# Altium project Karta_Radiowa_ILS_TETRA.PrjPcb (part 9 of 9)

## Sheet Current_volatge_meas.SchDoc: Current measurement
size A3; SheetNumber: 11; SheetTotal: 17
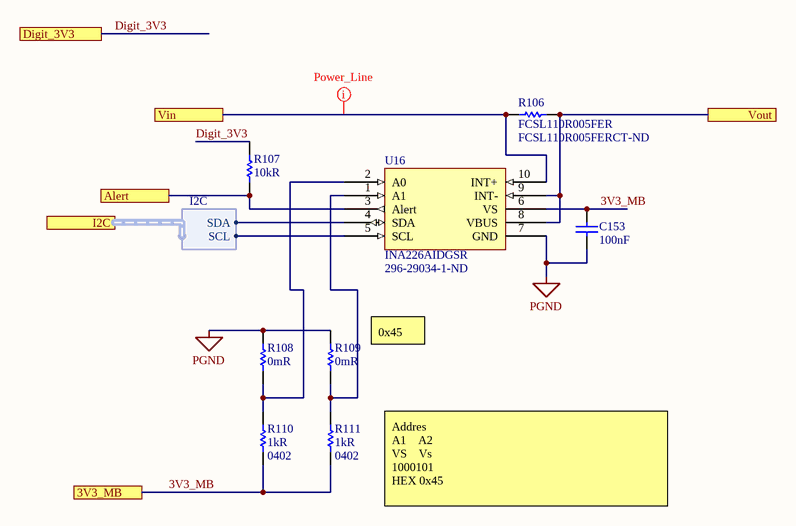
[diagram p13: Current_volatge_meas.SchDoc]

### Parts
C153  100nF  [CAP 0201/0603 KK]
R106  FCSL110R005FER  [FCSL110R005FERCT-ND]
R107  10kR  [RES 0402/1005 RF KK]
R108  0mR  [RES 0402/1005 RF KK]
R109  0mR  [RES 0402/1005 RF KK]
R110  1kR  Case/Package: 0402  [RES 0402/1005 RF KK]
R111  1kR  Case/Package: 0402  [RES 0402/1005 RF KK]
U16  INA226AIDGSR  Supplier Part Number 1: 296-29034-1-ND  [INA226]

### Ports
3V3_MB, Alert, Digit_3V3, I2C (harness I2C), Vin, Vout

### Harnesses
I2C: SDA, SCL

### Nets
+12: R106.1 U16.10(INT+) ; port Vin
PGND: C153.1 R108.2 R109.2 U16.7(GND)
3V3_MB: C153.2 R110.1 R111.1 U16.6(VS) ; port 3V3_MB
12V: R106.2 U16.8(VBUS) U16.9(INT-) ; port Vout
Alert_curr_vol_meas: R107.1 U16.3(Alert) ; port Alert
Digit_3V3: R107.2 ; port Digit_3V3  [project net 3V3_DIGIT]
I2C_SCL: U16.5(SCL) ; port I2C.SCL
I2C_SDA: U16.4(SDA) ; port I2C.SDA
NetR108_1: R108.1 R110.2 U16.2(A0)
NetR109_1: R109.1 R111.2 U16.1(A1)

### Layout directives
net class Power_LINE: +12

### Notes on the sheet
- (near R109) 0x45
- Addres
  A1    A2
  VS    Vs
  1000101
  HEX 0x45
- Title
- Size:
- Date:
- A3
- Number:
- Time:
- Revision:
- Sheet
- of
- File:

### Library data of the parts
C153 = Capacitor: Manufacturer 1: Murata; Manufacturer Part Number 1: GRM033R61C104ME84D; Voltage Rating: 16V; Tolerance: 20%; Dielectric: X5R; Supplier 1: Digi-Key; Supplier Part Number 1: 490-9986-1-ND; Stock 1: 503570; Pricing 1: 1=0.10000, 10=0.05400, 100=0.02430, 500=0.01732, 1000=0.01361, 2500=0.01238, 5000=0.01139 (USD); RoHS: Yes; Mount: Surface Mount; Case/Package: 0201; Weight: 1.2E-05oz; Case Code (Metric): 0603; Case Code (Imperial): 0201; Min Operating Temperature: -55°C; Max Operating Temperature: 85°C; Capacitance: 100nF; Packaging: Tape and Reel; Termination: SMD/SMT; Voltage Rating (DC): 16V; Package Quantity: 15000; Length: 0.024inch; Height: 0.3mm; Width: 0.3mm; Thickness: 0.013inch; ComponentLink1URL: http://www.mouser.com/ds/2/281/c02e-2905.pdf?src-supplier=Mouser; ComponentLink1Description: http://www.mouser.com/ds/2/281/c02e-2905.pdf?src-supplier=Mouser; ComponentLink2URL: http://search.murata.co.jp/Ceramy/image/img/A01X/G101/ENG/GRM033R61C104ME84-01.pdf?src-supplier=Digi-Key; ComponentLink2Description: http://search.murata.co.jp/Ceramy/image/img/A01X/G101/ENG/GRM033R61C104ME84-01.pdf?src-supplier=Digi-Key
R106 = FCSL110R005FER: RES SMD 5 MOHM 5W 4320 WIDE; Manufacturer: Ohmite; Tolerance: 1%; Resistance: 5mR; Temperature Coefficient: 50ppm/°C; Supplier 1: Digi-Key; Manufacturer Part Number: FCSL110R005FER; Stock 1: 3877; Pricing 1: 1 = 2,79000, 10 = 2,47700, 25 = 2,29720, 50 = 2,16220, 100 = 1,89190, 250 = 1,62164, 500 = 1,35136 (USD); RoHS: Yes; Case/Package: Metal; Number of Pins: 2; Min Operating Temperature: -55°C; Max Operating Temperature: 155°C; Packaging: Tape and Reel; Package Quantity: 1; Max Power Dissipation: 5W; Features: Moisture Resistant; Power Rating: 5W; Termination: SMD/SMT; Composition: Metal Foil; Number of Terminations: 2; Length: 0.197inch; Height: 0.028inch; Width: 11mm; Depth: 5mm; REACH SVHC: Unknown; ComponentLink1URL: https://datasheet.ciiva.com/2484/res-fcsl-2484643.pdf?src-supplier=Digi-Key; ComponentLink1Description: https://datasheet.ciiva.com/2484/res-fcsl-2484643.pdf?src-supplier=Digi-Key; ComponentLink2URL: https://datasheet.ciiva.com/2484/res-fcsl-2484644.pdf?src-supplier=Digi-Key; ComponentLink2Description: https://datasheet.ciiva.com/2484/res-fcsl-2484644.pdf?src-supplier=Digi-Key; ComponentLink3URL: https://datasheet.ciiva.com/2484/res-fcsl-2484645.pdf?src-supplier=Digi-Key; ComponentLink3Description: https://datasheet.ciiva.com/2484/res-fcsl-2484645.pdf?src-supplier=Digi-Key; ComponentLink4URL: https://datasheet.ciiva.com/6181/fcsl-6181333.pdf?src-supplier=Farnell; ComponentLink4Description: https://datasheet.ciiva.com/6181/fcsl-6181333.pdf?src-supplier=Farnell; ComponentLink5URL: https://datasheet.ciiva.com/46422/1812595-46422917.pdf?src-supplier=Element14; ComponentLink5Description: https://datasheet.ciiva.com/46422/1812595-46422917.pdf?src-supplier=Element14; ComponentLink6URL: https://datasheet.ciiva.com/8080/fcsl-8080343.pdf?src-supplier=Element14; ComponentLink6Description: https://datasheet.ciiva.com/8080/fcsl-8080343.pdf?src-supplier=Element14; Supplier Part Number 1: FCSL110R005FERCT-ND
R107 = Resistor: Manufacturer 1: Vishay; Manufacturer Part Number 1: CRCW0402-10K0FKED; Tolerance: 1%; Power Rating: 63mW; Voltage Rating: 50V; Temperature Coefficient: 100ppm/°C; Supplier 1: Newark; Supplier Part Number 1: 52K6595; Stock 1: 0; RoHS: Yes; Mount: Surface Mount; Case/Package: 0402; Number of Pins: 2; Weight: 2.3E-05oz; Case Code (Metric): 1005; Case Code (Imperial): 0402; Contact Plating: Tin; Min Operating Temperature: -55°C; Max Operating Temperature: 155°C; Resistance: 10kR; Package Quantity: 10; Packaging: Tape and Reel; Termination: SMD/SMT; Military Standard: Not; Composition: Thick Film; Voltage Rating (DC): 50V; Number of Terminations: 2; Max Power Dissipation: 63mW; Features: Automotive AEC-Q200; Length: 1mm; Height: 0.35mm; Depth: 0.5mm; Width: 0.02inch; Radiation Hardening: No; REACH SVHC: Unknown; Lead Free: Lead Free; ComponentLink1URL: https://datasheet.ciiva.com/11809/0900766b80d98824-11809984.pdf?src-supplier=RSComponents; ComponentLink1Description: https://datasheet.ciiva.com/11809/0900766b80d98824-11809984.pdf?src-supplier=RSComponents; ComponentLink2URL: https://datasheet.ciiva.com/2463/dcrcwe3-2463025.pdf?src-supplier=Digi-Key; ComponentLink2Description: https://datasheet.ciiva.com/2463/dcrcwe3-2463025.pdf?src-supplier=Digi-Key; ComponentLink3URL: https://datasheet.ciiva.com/2463/dcrcwe3-2463026.pdf?src-supplier=Digi-Key; ComponentLink3Description: https://datasheet.ciiva.com/2463/dcrcwe3-2463026.pdf?src-supplier=Digi-Key; ComponentLink4URL: https://datasheet.ciiva.com/2463/dcrcwe3-2463027.pdf?src-supplier=Digi-Key; ComponentLink4Description: https://datasheet.ciiva.com/2463/dcrcwe3-2463027.pdf?src-supplier=Digi-Key; ComponentLink5URL: https://datasheet.ciiva.com/46385/1697337-46385560.pdf?src-supplier=Element14; ComponentLink5Description: https://datasheet.ciiva.com/46385/1697337-46385560.pdf?src-supplier=Element14; ComponentLink6URL: https://datasheet.ciiva.com/3255/dcrcwe3-3255961.pdf?src-supplier=Avnet; ComponentLink6Description: https://datasheet.ciiva.com/3255/dcrcwe3-3255961.pdf?src-supplier=Avnet; ComponentLink7URL: https://datasheet.ciiva.com/3255/dcrcwe3-3255962.pdf?src-supplier=Avnet; ComponentLink7Description: https://datasheet.ciiva.com/3255/dcrcwe3-3255962.pdf?src-supplier=Avnet; ComponentLink8URL: https://datasheet.ciiva.com/5547/dcrcwe3-109170-5547786.pdf?src-supplier=Mouser; ComponentLink8Description: https://datasheet.ciiva.com/5547/dcrcwe3-109170-5547786.pdf?src-supplier=Mouser; ComponentLink9URL: https://datasheet.ciiva.com/26316/fld-crcw-e3-data-en-26316618.pdf?src-supplier=Distrelec; ComponentLink9Description: https://datasheet.ciiva.com/26316/fld-crcw-e3-data-en-26316618.pdf?src-supplier=Distrelec; ComponentLink10URL: https://datasheet.ciiva.com/16208/dcrcwe3-16208525.pdf?src-supplier=Future+Electronics; ComponentLink10Description: https://datasheet.ciiva.com/16208/dcrcwe3-16208525.pdf?src-supplier=Future+Electronics; ComponentLink11URL: https://datasheet.ciiva.com/36856/1720486-36856909.pdf?src-supplier=Element14; ComponentLink11Description: https://datasheet.ciiva.com/36856/1720486-36856909.pdf?src-supplier=Element14
R108 R109 = Resistor: Manufacturer 1: Yageo; Manufacturer Part Number 1: RC0402JR-070RL; Power Rating: 62.5mW; Tolerance: 5%; Voltage Rating: 50V; Max Power Dissipation: 63mW; Temperature Coefficient: 200ppm/°C; Supplier 1: Digi-Key; Supplier Part Number 1: 311-0.0JRCT-ND; Stock 1: 69822252; Pricing 1: 1=0.10000, 10=0.01200, 25=0.00920, 50=0.00680, 100=0.00510, 250=0.00388, 500=0.00308, 1000=0.00227, 5000=0.00163 (USD); RoHS: Yes; Case/Package: 0402; Contact Plating: Tin,Matte; Case Code (Metric): 1005; Case Code (Imperial): 0402; Min Operating Temperature: -55°C; Max Operating Temperature: 155°C; Resistance: 0mR; Packaging: Tape and Reel; Composition: Thick Film; Package Quantity: 1; Number of Terminations: 2; Termination: SMD/SMT; Military Standard: Not; Features: Moisture Resistant; Length: 1mm; Height: 0.016inch; Width: 0.02inch; Depth: 0.5mm; Radiation Hardening: No; REACH SVHC: Unknown; Lead Free: Lead Free; ComponentLink1URL: https://datasheet.ciiva.com/2452/pyu-rc0402-51-rohs-l-6-2452608.pdf?src-supplier=Digi-Key; ComponentLink1Description: https://datasheet.ciiva.com/2452/pyu-rc0402-51-rohs-l-6-2452608.pdf?src-supplier=Digi-Key; ComponentLink2URL: https://datasheet.ciiva.com/11808/0900766b80c66297-11808195.pdf?src-supplier=RSComponents; ComponentLink2Description: https://datasheet.ciiva.com/11808/0900766b80c66297-11808195.pdf?src-supplier=RSComponents; ComponentLink3URL: https://datasheet.ciiva.com/2452/pyu-r-int-thick-7-2452609.pdf?src-supplier=Digi-Key; ComponentLink3Description: https://datasheet.ciiva.com/2452/pyu-r-int-thick-7-2452609.pdf?src-supplier=Digi-Key; ComponentLink4URL: https://datasheet.ciiva.com/22747/1018594-22747515.pdf?src-supplier=Element14; ComponentLink4Description: https://datasheet.ciiva.com/22747/1018594-22747515.pdf?src-supplier=Element14; ComponentLink5URL: https://datasheet.ciiva.com/7983/1018594-7983535.pdf?src-supplier=Element14; ComponentLink5Description: https://datasheet.ciiva.com/7983/1018594-7983535.pdf?src-supplier=Element14; ComponentLink6URL: https://datasheet.ciiva.com/2452/pyu-r-int-thick-7-2452610.pdf?src-supplier=Digi-Key; ComponentLink6Description: https://datasheet.ciiva.com/2452/pyu-r-int-thick-7-2452610.pdf?src-supplier=Digi-Key; ComponentLink7URL: https://datasheet.ciiva.com/8896/pyu-rc0402-51-rohs-l-6-8896201.pdf?src-supplier=Avnet; ComponentLink7Description: https://datasheet.ciiva.com/8896/pyu-rc0402-51-rohs-l-6-8896201.pdf?src-supplier=Avnet; ComponentLink8URL: https://datasheet.ciiva.com/28386/pyu-rc0402-51-rohs-l-6-28386633.pdf?src-supplier=Avnet+Europe; ComponentLink8Description: https://datasheet.ciiva.com/28386/pyu-rc0402-51-rohs-l-6-28386633.pdf?src-supplier=Avnet+Europe; ComponentLink9URL: https://datasheet.ciiva.com/15189/getdatasheetpartid-326379-15189533.pdf?src-supplier=Verical; ComponentLink9Description: https://datasheet.ciiva.com/15189/getdatasheetpartid-326379-15189533.pdf?src-supplier=Verical
R110 R111 = Resistor: Manufacturer 1: Yageo; Manufacturer Part Number 1: RC0402FR-071KL; Tolerance: 1%; Temperature Coefficient: 100ppm/°C; Power Rating: 62.5mW; Voltage Rating: 50V; Supplier 1: Digi-Key; Supplier Part Number 1: 311-1.00KLRCT-ND; Stock 1: 57541929; Pricing 1: 1=0,10000, 10=0,01600, 100=0,00640, 1000=0,00289, 2500=0,00251, 5000=0,00207 (USD); RoHS: Yes; Number of Pins: 2; Case Code (Imperial): 0402; Case Code (Metric): 1005; Min Operating Temperature: -55°C; Max Operating Temperature: 155°C; Packaging: Tape and Reel; Resistance: 1kR; Composition: Thick Film; Voltage Rating (DC): 50V; Termination: SMD/SMT; Military Standard: Not; Length: 1mm; Height: 0.32mm; Width: 0.5mm; Depth: 0.5mm; REACH SVHC: Unknown; Lead Free: Lead Free; ComponentLink1URL: https://datasheet.ciiva.com/11819/0900766b80c66297-11819477.pdf?src-supplier=RSComponents; ComponentLink1Description: https://datasheet.ciiva.com/11819/0900766b80c66297-11819477.pdf?src-supplier=RSComponents; ComponentLink2URL: https://datasheet.ciiva.com/12666/pyu-rc0402-51-rohs-l-6-r-12666741.pdf?src-supplier=Mouser; ComponentLink2Description: https://datasheet.ciiva.com/12666/pyu-rc0402-51-rohs-l-6-r-12666741.pdf?src-supplier=Mouser; ComponentLink3URL: https://datasheet.ciiva.com/17063/pyu-rc0402-51-rohs-l-6-r-17063193.pdf?src-supplier=Future+Electronics; ComponentLink3Description: https://datasheet.ciiva.com/17063/pyu-rc0402-51-rohs-l-6-r-17063193.pdf?src-supplier=Future+Electronics; ComponentLink4URL: https://datasheet.ciiva.com/22747/1018594-22747513.pdf?src-supplier=Element14; ComponentLink4Description: https://datasheet.ciiva.com/22747/1018594-22747513.pdf?src-supplier=Element14; ComponentLink5URL: https://datasheet.ciiva.com/7849/1018594-7849869.pdf?src-supplier=Element14; ComponentLink5Description: https://datasheet.ciiva.com/7849/1018594-7849869.pdf?src-supplier=Element14; ComponentLink6URL: https://datasheet.ciiva.com/7983/1018594-7983502.pdf?src-supplier=Element14; ComponentLink6Description: https://datasheet.ciiva.com/7983/1018594-7983502.pdf?src-supplier=Element14; ComponentLink7URL: https://datasheet.ciiva.com/7849/1018594-7849871.pdf?src-supplier=Element14; ComponentLink7Description: https://datasheet.ciiva.com/7849/1018594-7849871.pdf?src-supplier=Element14
U16 = INA226AIDGSR: IC MONITOR PWR/CURR BIDIR 10MSOP; Manufacturer: Texas Instruments; Min Supply Voltage: 2.7V; Max Supply Voltage: 5.5V; Nominal Supply Current: 330uA; Common Mode Rejection Ratio: 140dB; Output Current: 10mA; Input Bias Current: 10uA; Input Offset Voltage (Vos): 2.5uV; Accuracy: 0.02%; Supplier 1: Digi-Key; Manufacturer Part Number: INA226AIDGSR; Stock 1: 62024; Pricing 1: 1 = 2,88000, 10 = 2,58900, 100 = 2,12100, 500 = 1,80554, 1000 = 1,52275 (USD); RoHS: Yes; Mount: Surface Mount; Case/Package: VSSOP; Number of Pins: 10; Contact Plating: Gold; Min Operating Temperature: -40°C; Max Operating Temperature: 125°C; Packaging: Tape and Reel; Package Quantity: 1; Radiation Hardening: No; REACH SVHC: No SVHC; Lead Free: Lead Free; ComponentLink1URL: https://datasheet.ciiva.com/1939/ina226-1939633.pdf?src-supplier=Digi-Key; ComponentLink1Description: https://datasheet.ciiva.com/1939/ina226-1939633.pdf?src-supplier=Digi-Key; ComponentLink2URL: https://datasheet.ciiva.com/4875/sbos547-126280-4875559.pdf?src-supplier=Mouser; ComponentLink2Description: https://datasheet.ciiva.com/4875/sbos547-126280-4875559.pdf?src-supplier=Mouser; ComponentLink3URL: https://datasheet.ciiva.com/1939/ina226-1939634.pdf?src-supplier=Digi-Key; ComponentLink3Description: https://datasheet.ciiva.com/1939/ina226-1939634.pdf?src-supplier=Digi-Key; ComponentLink4URL: https://datasheet.ciiva.com/1939/ina226-1939635.pdf?src-supplier=Digi-Key; ComponentLink4Description: https://datasheet.ciiva.com/1939/ina226-1939635.pdf?src-supplier=Digi-Key; ComponentLink5URL: https://datasheet.ciiva.com/14196/ina226-14196741.pdf?src-supplier=Avnet; ComponentLink5Description: https://datasheet.ciiva.com/14196/ina226-14196741.pdf?src-supplier=Avnet; ComponentLink6URL: https://datasheet.ciiva.com/22693/1840205-22693516.pdf?src-supplier=Element14; ComponentLink6Description: https://datasheet.ciiva.com/22693/1840205-22693516.pdf?src-supplier=Element14

## Sheet Flash_memory.SchDoc: Flash memory
size A3; SheetNumber: 12; SheetTotal: 17
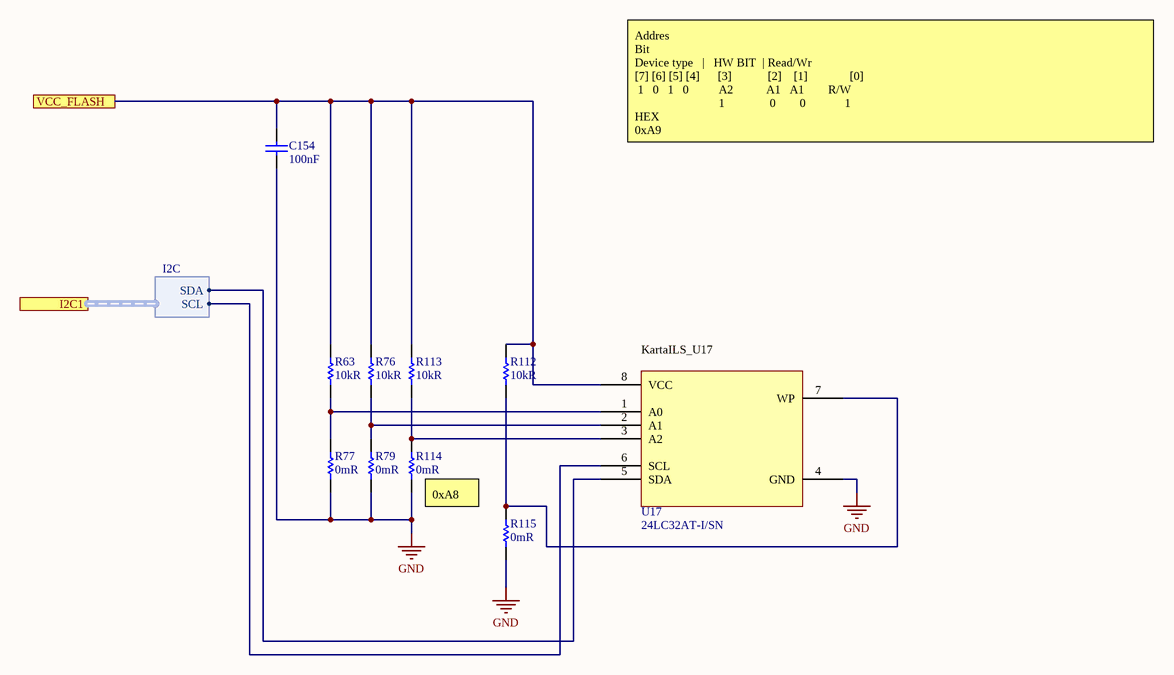
[diagram p14: Flash_memory.SchDoc]

### Parts
C154  100nF  [CAP 0201/0603 KK]
R63  10kR  [RES 0402/1005 RF KK]
R76  10kR  [RES 0402/1005 RF KK]
R77  0mR  [RES 0402/1005 RF KK]
R79  0mR  [RES 0402/1005 RF KK]
R112  10kR  [RES 0402/1005 RF KK]
R113  10kR  [RES 0402/1005 RF KK]
R114  0mR  [RES 0402/1005 RF KK]
R115  0mR  [RES 0402/1005 RF KK]
U17  24LC32AT-I/SN  [8-SOIC 3.9]

### Ports
I2C1 (harness I2C), VCC_FLASH

### Harnesses
I2C: SDA, SCL

### Nets
GND: C154.1 R77.1 R79.1 R114.1 R115.1 U17.4(GND)
3V3_MB: C154.2 R63.2 R76.2 R112.2 R113.2 U17.8(VCC) ; port VCC_FLASH
I2C_SCL: U17.6(SCL) ; port I2C1.SCL
I2C_SDA: U17.5(SDA) ; port I2C1.SDA
NetR63_1: R63.1 R77.2 U17.1(A0)
NetR76_1: R76.1 R79.2 U17.2(A1)
NetR112_1: R112.1 R115.2 U17.7(WP)
NetR113_1: R113.1 R114.2 U17.3(A2)

### Notes on the sheet
- Addres
  Bit
  Device type   |   HW BIT		| Read/Wr
  [7] [6] [5] [4]      [3]            [2]    [1]              [0]
  1   0   1   0          A2           A1   A1        R/W
  1               0        0             1
  HEX
  0xA9
- (near U17) KartaILS_U17
- (near R114) 0xA8
- Title
- Size:
- Date:
- A3
- Number:
- Time:
- Revision:
- Sheet
- of
- File:

### Library data of the parts
C154 = Capacitor: as C153 on sheet Current_volatge_meas; Supplier 1: Digi-Key; Supplier Part Number 1: 490-9986-1-ND; Stock 1: 503570; Pricing 1: 1=0.10000, 10=0.05400, 100=0.02430, 500=0.01732, 1000=0.01361, 2500=0.01238, 5000=0.01139 (USD); RoHS: Yes; Mount: Surface Mount; Case/Package: 0201; Weight: 1.2E-05oz; Case Code (Metric): 0603; Case Code (Imperial): 0201; Min Operating Temperature: -55°C; Max Operating Temperature: 85°C; Capacitance: 100nF; Packaging: Tape and Reel; Termination: SMD/SMT; Voltage Rating (DC): 16V; Package Quantity: 15000; Length: 0.024inch; Height: 0.3mm; Width: 0.3mm; Thickness: 0.013inch; ComponentLink1URL: http://www.mouser.com/ds/2/281/c02e-2905.pdf?src-supplier=Mouser; ComponentLink1Description: http://www.mouser.com/ds/2/281/c02e-2905.pdf?src-supplier=Mouser; ComponentLink2URL: http://search.murata.co.jp/Ceramy/image/img/A01X/G101/ENG/GRM033R61C104ME84-01.pdf?src-supplier=Digi-Key; ComponentLink2Description: http://search.murata.co.jp/Ceramy/image/img/A01X/G101/ENG/GRM033R61C104ME84-01.pdf?src-supplier=Digi-Key
R63 R76 R112 R113 = Resistor: as R107 on sheet Current_volatge_meas; Supplier 1: Newark; Supplier Part Number 1: 52K6595; Stock 1: 0; RoHS: Yes; Mount: Surface Mount; Case/Package: 0402; Number of Pins: 2; Weight: 2.3E-05oz; Case Code (Metric): 1005; Case Code (Imperial): 0402; Contact Plating: Tin; Min Operating Temperature: -55°C; Max Operating Temperature: 155°C; Resistance: 10kR; Package Quantity: 10; Packaging: Tape and Reel; Termination: SMD/SMT; Military Standard: Not; Composition: Thick Film; Voltage Rating (DC): 50V; Number of Terminations: 2; Max Power Dissipation: 63mW; Features: Automotive AEC-Q200; Length: 1mm; Height: 0.35mm; Depth: 0.5mm; Width: 0.02inch; Radiation Hardening: No; REACH SVHC: Unknown; Lead Free: Lead Free; ComponentLink1URL: https://datasheet.ciiva.com/11809/0900766b80d98824-11809984.pdf?src-supplier=RSComponents; ComponentLink1Description: https://datasheet.ciiva.com/11809/0900766b80d98824-11809984.pdf?src-supplier=RSComponents; ComponentLink2URL: https://datasheet.ciiva.com/2463/dcrcwe3-2463025.pdf?src-supplier=Digi-Key; ComponentLink2Description: https://datasheet.ciiva.com/2463/dcrcwe3-2463025.pdf?src-supplier=Digi-Key; ComponentLink3URL: https://datasheet.ciiva.com/2463/dcrcwe3-2463026.pdf?src-supplier=Digi-Key; ComponentLink3Description: https://datasheet.ciiva.com/2463/dcrcwe3-2463026.pdf?src-supplier=Digi-Key; ComponentLink4URL: https://datasheet.ciiva.com/2463/dcrcwe3-2463027.pdf?src-supplier=Digi-Key; ComponentLink4Description: https://datasheet.ciiva.com/2463/dcrcwe3-2463027.pdf?src-supplier=Digi-Key; ComponentLink5URL: https://datasheet.ciiva.com/46385/1697337-46385560.pdf?src-supplier=Element14; ComponentLink5Description: https://datasheet.ciiva.com/46385/1697337-46385560.pdf?src-supplier=Element14; ComponentLink6URL: https://datasheet.ciiva.com/3255/dcrcwe3-3255961.pdf?src-supplier=Avnet; ComponentLink6Description: https://datasheet.ciiva.com/3255/dcrcwe3-3255961.pdf?src-supplier=Avnet; ComponentLink7URL: https://datasheet.ciiva.com/3255/dcrcwe3-3255962.pdf?src-supplier=Avnet; ComponentLink7Description: https://datasheet.ciiva.com/3255/dcrcwe3-3255962.pdf?src-supplier=Avnet; ComponentLink8URL: https://datasheet.ciiva.com/5547/dcrcwe3-109170-5547786.pdf?src-supplier=Mouser; ComponentLink8Description: https://datasheet.ciiva.com/5547/dcrcwe3-109170-5547786.pdf?src-supplier=Mouser; ComponentLink9URL: https://datasheet.ciiva.com/26316/fld-crcw-e3-data-en-26316618.pdf?src-supplier=Distrelec; ComponentLink9Description: https://datasheet.ciiva.com/26316/fld-crcw-e3-data-en-26316618.pdf?src-supplier=Distrelec; ComponentLink10URL: https://datasheet.ciiva.com/16208/dcrcwe3-16208525.pdf?src-supplier=Future+Electronics; ComponentLink10Description: https://datasheet.ciiva.com/16208/dcrcwe3-16208525.pdf?src-supplier=Future+Electronics; ComponentLink11URL: https://datasheet.ciiva.com/36856/1720486-36856909.pdf?src-supplier=Element14; ComponentLink11Description: https://datasheet.ciiva.com/36856/1720486-36856909.pdf?src-supplier=Element14
R77 R79 R115 = Resistor: YAGEO - RC0402JR-070RL. - RES, THICK FILM, 0R, 0.0625W, 0402; Power Rating: 62.5mW; Tolerance: 5%; Voltage Rating: 50V; Max Power Dissipation: 63mW; Temperature Coefficient: 200ppm/°C; Supplier 1: Digi-Key; Supplier Part Number 1: 311-0.0JRCT-ND; Manufacturer: Yageo; Manufacturer Part Number: RC0402JR-070RL; RoHS: Yes; Category: Chip SMD Resistors; Stock 1: 45338179; Pricing 1: 1=0,10000, 10=0,01200, 25=0,00920, 50=0,00680, 100=0,00510, 250=0,00388, 500=0,00310, 1000=0,00228, 5000=0,00163 (USD); Case/Package: 0402; Case Code (Metric): 1005; Case Code (Imperial): 0402; Contact Plating: Tin,Matte; Min Operating Temperature: -55°C; Max Operating Temperature: 155°C; Package Quantity: 1; Resistance: 0mR; Packaging: Tape and Reel; Resistor Type: Thick Film; Number of Terminations: 2; Termination: SMD/SMT; Features: Moisture Resistant; Length: 1mm; Height: 0.016inch; Width: 0.02inch; Depth: 0.5mm; Radiation Hardening: No; REACH SVHC: Unknown; Military Standard: Not; Lead Free: Lead Free; ComponentLink1URL: https://datasheet.ciiva.com/2452/pyu-rc0402-51-rohs-l-6-2452608.pdf?src-supplier=Digi-Key; ComponentLink1Description: https://datasheet.ciiva.com/2452/pyu-rc0402-51-rohs-l-6-2452608.pdf?src-supplier=Digi-Key; ComponentLink2URL: https://datasheet.ciiva.com/11808/0900766b80c66297-11808195.pdf?src-supplier=RSComponents; ComponentLink2Description: https://datasheet.ciiva.com/11808/0900766b80c66297-11808195.pdf?src-supplier=RSComponents; ComponentLink3URL: https://datasheet.ciiva.com/2452/pyu-r-int-thick-7-2452609.pdf?src-supplier=Digi-Key; ComponentLink3Description: https://datasheet.ciiva.com/2452/pyu-r-int-thick-7-2452609.pdf?src-supplier=Digi-Key; ComponentLink4URL: https://datasheet.ciiva.com/2452/pyu-r-int-thick-7-2452610.pdf?src-supplier=Digi-Key; ComponentLink4Description: https://datasheet.ciiva.com/2452/pyu-r-int-thick-7-2452610.pdf?src-supplier=Digi-Key; ComponentLink5URL: https://datasheet.ciiva.com/8896/pyu-rc0402-51-rohs-l-6-8896201.pdf?src-supplier=Avnet; ComponentLink5Description: https://datasheet.ciiva.com/8896/pyu-rc0402-51-rohs-l-6-8896201.pdf?src-supplier=Avnet; ComponentLink6URL: https://datasheet.ciiva.com/28386/pyu-rc0402-51-rohs-l-6-28386633.pdf?src-supplier=Avnet+Europe; ComponentLink6Description: https://datasheet.ciiva.com/28386/pyu-rc0402-51-rohs-l-6-28386633.pdf?src-supplier=Avnet+Europe; ComponentLink7URL: https://datasheet.ciiva.com/22747/1018594-22747515.pdf?src-supplier=Element14; ComponentLink7Description: https://datasheet.ciiva.com/22747/1018594-22747515.pdf?src-supplier=Element14; ComponentLink8URL: https://datasheet.ciiva.com/15189/getdatasheetpartid-326379-15189533.pdf?src-supplier=Verical; ComponentLink8Description: https://datasheet.ciiva.com/15189/getdatasheetpartid-326379-15189533.pdf?src-supplier=Verical
R114 = Resistor: as R108 on sheet Current_volatge_meas; Supplier 1: Digi-Key; Supplier Part Number 1: 311-0.0JRCT-ND; Stock 1: 69822252; Pricing 1: 1=0.10000, 10=0.01200, 25=0.00920, 50=0.00680, 100=0.00510, 250=0.00388, 500=0.00308, 1000=0.00227, 5000=0.00163 (USD); RoHS: Yes; Case/Package: 0402; Contact Plating: Tin,Matte; Case Code (Metric): 1005; Case Code (Imperial): 0402; Min Operating Temperature: -55°C; Max Operating Temperature: 155°C; Resistance: 0mR; Packaging: Tape and Reel; Composition: Thick Film; Package Quantity: 1; Number of Terminations: 2; Termination: SMD/SMT; Military Standard: Not; Features: Moisture Resistant; Length: 1mm; Height: 0.016inch; Width: 0.02inch; Depth: 0.5mm; Radiation Hardening: No; REACH SVHC: Unknown; Lead Free: Lead Free; ComponentLink1URL: https://datasheet.ciiva.com/2452/pyu-rc0402-51-rohs-l-6-2452608.pdf?src-supplier=Digi-Key; ComponentLink1Description: https://datasheet.ciiva.com/2452/pyu-rc0402-51-rohs-l-6-2452608.pdf?src-supplier=Digi-Key; ComponentLink2URL: https://datasheet.ciiva.com/11808/0900766b80c66297-11808195.pdf?src-supplier=RSComponents; ComponentLink2Description: https://datasheet.ciiva.com/11808/0900766b80c66297-11808195.pdf?src-supplier=RSComponents; ComponentLink3URL: https://datasheet.ciiva.com/2452/pyu-r-int-thick-7-2452609.pdf?src-supplier=Digi-Key; ComponentLink3Description: https://datasheet.ciiva.com/2452/pyu-r-int-thick-7-2452609.pdf?src-supplier=Digi-Key; ComponentLink4URL: https://datasheet.ciiva.com/22747/1018594-22747515.pdf?src-supplier=Element14; ComponentLink4Description: https://datasheet.ciiva.com/22747/1018594-22747515.pdf?src-supplier=Element14; ComponentLink5URL: https://datasheet.ciiva.com/7983/1018594-7983535.pdf?src-supplier=Element14; ComponentLink5Description: https://datasheet.ciiva.com/7983/1018594-7983535.pdf?src-supplier=Element14; ComponentLink6URL: https://datasheet.ciiva.com/2452/pyu-r-int-thick-7-2452610.pdf?src-supplier=Digi-Key; ComponentLink6Description: https://datasheet.ciiva.com/2452/pyu-r-int-thick-7-2452610.pdf?src-supplier=Digi-Key; ComponentLink7URL: https://datasheet.ciiva.com/8896/pyu-rc0402-51-rohs-l-6-8896201.pdf?src-supplier=Avnet; ComponentLink7Description: https://datasheet.ciiva.com/8896/pyu-rc0402-51-rohs-l-6-8896201.pdf?src-supplier=Avnet; ComponentLink8URL: https://datasheet.ciiva.com/28386/pyu-rc0402-51-rohs-l-6-28386633.pdf?src-supplier=Avnet+Europe; ComponentLink8Description: https://datasheet.ciiva.com/28386/pyu-rc0402-51-rohs-l-6-28386633.pdf?src-supplier=Avnet+Europe; ComponentLink9URL: https://datasheet.ciiva.com/15189/getdatasheetpartid-326379-15189533.pdf?src-supplier=Verical; ComponentLink9Description: https://datasheet.ciiva.com/15189/getdatasheetpartid-326379-15189533.pdf?src-supplier=Verical
U17 = 24LC32AT-I/SN: Microchip 24LC32AT-I/SN Serial EEPROM Memory, 32kbit, 1000ns, 2.5  5.5 V 8-Pin SOIC; Interface: I2C,Serial,2-Wire; Access Time: 900ns; Frequency: 400kHz; Max Supply Voltage: 5.5V; Min Supply Voltage: 2.5V; Nominal Supply Current: 3mA; Density: 32Kb; Number of Words: 4; Supplier 1: Digi-Key; Manufacturer: Microchip; Manufacturer Part Number: 24LC32AT-I/SN; RoHS: Yes; Category: EEPROM; Stock 1: 9460; Pricing 1: 1=0,34000, 25=0,33000, 100=0,31000 (USD); Mount: Surface Mount; Case/Package: SOIC; Number of Pins: 8; Contact Plating: Tin,Matte; Min Operating Temperature: -40°C; Max Operating Temperature: 85°C; Packaging: Tape and Reel; Package Quantity: 3300; Memory Type: EEPROM; Memory Size: 32Kb; Max Frequency: 400kHz; Length: 4.9mm; Height: 1.5mm; Width: 3.9mm; Radiation Hardening: No; REACH SVHC: No SVHC; Lead Free: Lead Free; ComponentLink1URL: https://datasheet.ciiva.com/1165/1669362-1165104.pdf?src-supplier=Newark; ComponentLink1Description: https://datasheet.ciiva.com/1165/1669362-1165104.pdf?src-supplier=Newark; ComponentLink2URL: https://datasheet.ciiva.com/15123/getdatasheetpartid-768552-15123863.pdf?src-supplier=Verical; ComponentLink2Description: https://datasheet.ciiva.com/15123/getdatasheetpartid-768552-15123863.pdf?src-supplier=Verical; ComponentLink3URL: https://datasheet.ciiva.com/14134/24aa32a-24lc32a-eng-tds-14134838.pdf?src-supplier=Distrelec; ComponentLink3Description: https://datasheet.ciiva.com/14134/24aa32a-24lc32a-eng-tds-14134838.pdf?src-supplier=Distrelec; ComponentLink4URL: https://datasheet.ciiva.com/8059/1669362-8059144.pdf?src-supplier=Element14; ComponentLink4Description: https://datasheet.ciiva.com/8059/1669362-8059144.pdf?src-supplier=Element14; ComponentLink5URL: https://datasheet.ciiva.com/3184/21713l-3184953.pdf?src-supplier=Avnet; ComponentLink5Description: https://datasheet.ciiva.com/3184/21713l-3184953.pdf?src-supplier=Avnet; ComponentLink6URL: https://datasheet.ciiva.com/17651/21713l-17651374.pdf?src-supplier=Avnet+Europe; ComponentLink6Description: https://datasheet.ciiva.com/17651/21713l-17651374.pdf?src-supplier=Avnet+Europe; Supplier Part Number 1: 24LC32AT-I/SNCT-ND

## Nets that join several sheets
+12: Connector miniPCIe (P1.2 P1.4), Current_volatge_meas (R106.1 U16.10)
GND: POWER_DISTRIBUTION (18 pins), ADC_LTC2122 (C62.1 C65.1 C66.1), Komunikacja (23 pins), CLOC_DISTR (26 pins), POWER_ADC (34 pins), POWER_CLK (65 pins), Connector miniPCIe (20 pins), Flash_memory (6 pins)
GND_ATT: Karta_ILS_TETRA (5 pins), POWER_DISTRIBUTION (6 pins), RF_LANES (C156.2 C158.1), TOR ILS (20 pins), U_RF_LANES/U_TOR ILS/U_ATT (15 pins), U_RF_LANES/U_RF_ANT_L (23 pins), U_RF_LANES/U_RF_ANT_M (23 pins), Tor_330MHz (20 pins), U_RF_LANES/U_Tor_330MHz/U_ATT (15 pins)
PGND: POWER_DISTRIBUTION (5 pins), Connector miniPCIe (P1.1 P1.3), Current_volatge_meas (C153.1 R108.2 R109.2 U16.7)
0F_N: ADC_LTC2122 (U6.41), Connector miniPCIe (J10.2 R17.1)
0F_P: ADC_LTC2122 (U6.42), Connector miniPCIe (J11.2 R17.2)
3V3_DIGIT: POWER_DISTRIBUTION (C9.2 FB1.2 R124.2), Komunikacja (14 pins), U_RF_LANES/U_RF_ANT_L (7 pins), U_RF_LANES/U_RF_ANT_M (7 pins), Current_volatge_meas (R107.2)
3V3_MB: Komunikacja (16 pins), Connector miniPCIe (P1.11), Current_volatge_meas (C153.2 R110.1 R111.1 U16.6), Flash_memory (6 pins)
3V6_DCDC: POWER_DISTRIBUTION (11 pins), POWER_ADC (7 pins), POWER_CLK (6 pins)
5V: POWER_DISTRIBUTION (C4.2 R122.2 U2.5), RF_LANES (FB24.1 FB25.1 FB26.1 FB27.1)
12V: POWER_DISTRIBUTION (9 pins), Current_volatge_meas (R106.2 U16.8 U16.9)
Ain_2122A_N: ADC_LTC2122 (R48.1 R49.1), RF_LANES (T3.3)
AIn_2122A_P: ADC_LTC2122 (R45.1 R46.2), RF_LANES (T3.1)
AIn_2122B_N: ADC_LTC2122 (R55.1 R56.1), RF_LANES (T2.1)
AIn_2122B_P: ADC_LTC2122 (R51.1 R52.2), RF_LANES (T2.3)
Alert_curr_vol_meas: Komunikacja (U8.19), Current_volatge_meas (R107.1 U16.3)
ATT_330_V1: Komunikacja (U7.19), U_RF_LANES/U_Tor_330MHz/U_ATT (R91_U_ATT2.2)
ATT_330_V2: Komunikacja (U7.20), U_RF_LANES/U_Tor_330MHz/U_ATT (U22_U_ATT2.20)
ATT_330_V3: Komunikacja (U7.21), U_RF_LANES/U_Tor_330MHz/U_ATT (U22_U_ATT2.21)
ATT_330_V4: Komunikacja (U7.22), U_RF_LANES/U_Tor_330MHz/U_ATT (U22_U_ATT2.22)
ATT_330_V5: Komunikacja (U7.23), U_RF_LANES/U_Tor_330MHz/U_ATT (U22_U_ATT2.23)
ATT_330_V6: Komunikacja (U7.24), U_RF_LANES/U_Tor_330MHz/U_ATT (U22_U_ATT2.24)
ATT_ILS_V1: Komunikacja (U7.27), U_RF_LANES/U_TOR ILS/U_ATT (R91_U_ATT1.2)
ATT_ILS_V2: Komunikacja (U7.28), U_RF_LANES/U_TOR ILS/U_ATT (U22_U_ATT1.20)
ATT_ILS_V3: Komunikacja (U7.1), U_RF_LANES/U_TOR ILS/U_ATT (U22_U_ATT1.21)
ATT_ILS_V4: Komunikacja (U7.2), U_RF_LANES/U_TOR ILS/U_ATT (U22_U_ATT1.22)
ATT_ILS_V5: Komunikacja (U7.3), U_RF_LANES/U_TOR ILS/U_ATT (U22_U_ATT1.23)
ATT_ILS_V6: Komunikacja (U7.4), U_RF_LANES/U_TOR ILS/U_ATT (U22_U_ATT1.24)
CLK_SYNC: Komunikacja (U23.3), Connector miniPCIe (P1.20)
CLKin1_N: CLOC_DISTR (R37.1 R39.1), Connector miniPCIe (P1.5)
CLKin1_P: CLOC_DISTR (R31.1 R32.2), Connector miniPCIe (P1.7)
CLKout3_C_N: CLOC_DISTR (C51.1), Connector miniPCIe (P1.48)
CLKout3_C_P: CLOC_DISTR (C50.1), Connector miniPCIe (P1.50)
CLKout5_C_N: CLOC_DISTR (C192.1), Connector miniPCIe (P1.39)
CLKout5_C_P: CLOC_DISTR (C193.1), Connector miniPCIe (P1.37)
CLKout8_C_N: ADC_LTC2122 (R43.2 U6.18), CLOC_DISTR (C53.1)
CLKout8_C_P: ADC_LTC2122 (R43.1 U6.19), CLOC_DISTR (C52.1)
CLKout10_C_N: ADC_LTC2122 (R44.2 U6.16), CLOC_DISTR (C56.1)
CLKout10_C_P: ADC_LTC2122 (R44.1 U6.15), CLOC_DISTR (C55.1)
CMLOUT_A_N: ADC_LTC2122 (C64.2 R82.1), Connector miniPCIe (P1.26)
CMLOUT_A_P: ADC_LTC2122 (C63.2 R82.2), Connector miniPCIe (P1.24)
CMLOUT_B_N: ADC_LTC2122 (C61.2 R81.1), Connector miniPCIe (P1.32)
CMLOUT_B_P: ADC_LTC2122 (C60.2 R81.2), Connector miniPCIe (P1.30)
EN_5V: POWER_DISTRIBUTION (U2.3), Komunikacja (U8.17)
EN_LMK_1V8: Komunikacja (U8.2), POWER_CLK (U15.6)
EN_LMK_3V3: Komunikacja (U8.1), POWER_CLK (U15.20)
EN_POWER_LTC2122: Komunikacja (U8.18), POWER_ADC (U14.4)
EN_RF_P_1: Komunikacja (U7.26), U_RF_LANES/U_RF_ANT_L (U4_U_RF_ANT_L.14)
EN_RF_P_2: Komunikacja (U7.17), U_RF_LANES/U_RF_ANT_M (U4_U_RF_ANT_M.14)
GND_VCXO: CLOC_DISTR (C42.1 X1.3), POWER_CLK (C111.1 C112.1 FB15.1)
I2C_SCL: Komunikacja (R66.1 R71.2 U9.3), Current_volatge_meas (U16.5), Flash_memory (U17.6)
I2C_SDA: Komunikacja (R65.1 R70.2 U9.4), Current_volatge_meas (U16.4), Flash_memory (U17.5)
LMK_CLKsel: Komunikacja (U23.12), CLOC_DISTR (U5.34)
NetC111_2: CLOC_DISTR (X1.6), POWER_CLK (C111.2 C112.2 FB12.2)
NetC164_1: RF_LANES (C164.1), Tor_330MHz (R119.1)
NetC173_1: Tor_330MHz (C173.1), U_RF_LANES/U_Tor_330MHz/U_ATT (U22_U_ATT2.15)
NetC175_2: RF_LANES (C175.2), TOR ILS (R116.1)
NetC178_1: TOR ILS (C178.1), U_RF_LANES/U_TOR ILS/U_ATT (U22_U_ATT1.15)
NetR9_U_RF_ANT_L_2: U_RF_LANES/U_TOR ILS/U_ATT (U22_U_ATT1.4), U_RF_LANES/U_RF_ANT_L (R9_U_RF_ANT_L.2)
NetR9_U_RF_ANT_M_2: U_RF_LANES/U_RF_ANT_M (R9_U_RF_ANT_M.2), U_RF_LANES/U_Tor_330MHz/U_ATT (U22_U_ATT2.4)
PERST2#: Komunikacja (U8.16), Connector miniPCIe (P1.43)
PERST#: Komunikacja (R1.2 U7.14 U8.14 U9.8), Connector miniPCIe (P1.18)
PG_LMK_1V8: Komunikacja (U8.3), POWER_CLK (R105.1 U15.9)
PG_LMK_3V3: Komunikacja (U8.28), POWER_CLK (R104.1 U15.17)
PG_LTC2122: Komunikacja (U8.20), POWER_ADC (R97.1 U14.5)
Q: Komunikacja (U8.26), U_RF_LANES/U_RF_ANT_M (R93_U_RF_ANT_M.3 U4_U_RF_ANT_M.13)
Q: Komunikacja (U8.27), U_RF_LANES/U_RF_ANT_L (R93_U_RF_ANT_L.3 U4_U_RF_ANT_L.13)
~{Q}: U_RF_LANES/U_TOR ILS/U_ATT (R91_U_ATT1.1 U22_U_ATT1.19), U_RF_LANES/U_RF_ANT_L (R92_U_RF_ANT_L.3 U4_U_RF_ANT_L.12)
~{Q}: U_RF_LANES/U_RF_ANT_M (R92_U_RF_ANT_M.3 U4_U_RF_ANT_M.12), U_RF_LANES/U_Tor_330MHz/U_ATT (R91_U_ATT2.1 U22_U_ATT2.19)
RST_RF_P_1: Komunikacja (U7.25), U_RF_LANES/U_RF_ANT_L (U4_U_RF_ANT_L.15)
RST_RF_P_2: Komunikacja (U7.18), U_RF_LANES/U_RF_ANT_M (U4_U_RF_ANT_M.15)
SMCLK: Komunikacja (R71.1), Connector miniPCIe (P1.15)
SMDAT: Komunikacja (R70.1), Connector miniPCIe (P1.13)
SPI_1V8_ADC: Komunikacja (C15.1 R14.2 R15.2 U11.13), POWER_ADC (9 pins)
SPI_1V8_CLK: Komunikacja (C71.1 R12.2 U10.13 U23.13), POWER_CLK (29 pins)
SPI_CLK_LTC: ADC_LTC2122 (U6.45), Komunikacja (U11.12)
SPI_CLK_MB: Komunikacja (U10.1 U11.1), Connector miniPCIe (P1.45)
SPI_CS_LTC: ADC_LTC2122 (U6.46), Komunikacja (R15.1 U11.9)
SPI_MISO_LTC: ADC_LTC2122 (U6.43), Komunikacja (R14.1 U11.10)
SPI_MISO_MB: Komunikacja (U10.3 U11.3), Connector miniPCIe (P1.49)
SPI_MOSI_LTC: ADC_LTC2122 (U6.44), Komunikacja (U11.11)
SPI_MOSI_MB: Komunikacja (U10.2 U11.2), Connector miniPCIe (P1.47)
SPI_nCS_1_MB: Komunikacja (R64.2 U10.4 U11.4), Connector miniPCIe (P1.51)
SYNC_N: ADC_LTC2122 (U6.22), Connector miniPCIe (P1.12)
SYNC_P: ADC_LTC2122 (U6.21), Connector miniPCIe (P1.14)
Vcc_5V_AMP_1: RF_LANES (FB26.2), TOR ILS (C171.1 R126.2)
Vcc_5V_AMP_2: RF_LANES (FB27.2), Tor_330MHz (C161.1 R84.2)
Vcc_5V_ATT_1: RF_LANES (FB24.2), U_RF_LANES/U_TOR ILS/U_ATT (C180_U_ATT1.2 C181_U_ATT1.2 U22_U_ATT1.2)
Vcc_5V_ATT_2: RF_LANES (FB25.2), U_RF_LANES/U_Tor_330MHz/U_ATT (C180_U_ATT2.2 C181_U_ATT2.2 U22_U_ATT2.2)

## Assembly variants
Variant_CLK_DNF: not fitted C38 C39 C40 C41 C42 C43 C44 C48 C49 C109 C110 C111 C112 C163 C168 C169 C188 C189 C190 C? C? C?_U_RF_ANT_L C?_U_RF_ANT_L C?_U_RF_ANT_M C?_U_RF_ANT_M FB12 FB15 R19 R19 R20 R21 R22 R23 R23 R40 R41 R42 R57 R61 R62 R64 R65 R66 R72 R73 R74 R108 R109 R114 R? R? R? R? R? R? R? R? R? R? R? R? R? R? R?_U_RF_ANT_L R?_U_RF_ANT_M X1